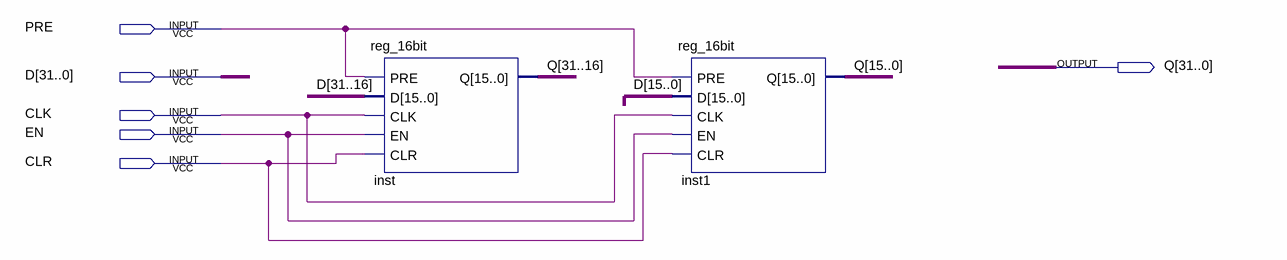
[diagram p0: schematic sheet]
// Quartus schematic reg_32bit.bdf as structural Verilog: 2 symbols, 6 pins
module reg_32bit (
  input  PRE,
  input  [31:0] D,
  input  CLK,
  input  EN,
  input  CLR,
  output [31:0] Q
);

  reg_16bit inst (.PRE(PRE), .D(D[31:16]), .CLK(CLK), .EN(EN), .CLR(CLR), .Q(Q[31:16]));
  reg_16bit inst1 (.PRE(PRE), .D(D[15:0]), .CLK(CLK), .EN(EN), .CLR(CLR), .Q(Q[15:0]));
endmodule
